# Altium schematic sheet ADC.SchDoc: Analogue to Digital Converter
size A4; ApprovedBy: LD Stanton; Author: LD Stanton; CompanyName: University of Cape Town; DrawnBy: Lawrence Stanton; Engineer: Lawrence Stanton; Organization: University of Cape Town; Address1: Department of Electrical Engineering; Address2: Rondebosch; Address3: Cape Town; Address4: South Africa 7701; DocumentNumber: 8; SheetNumber: 8; SheetTotal: 14
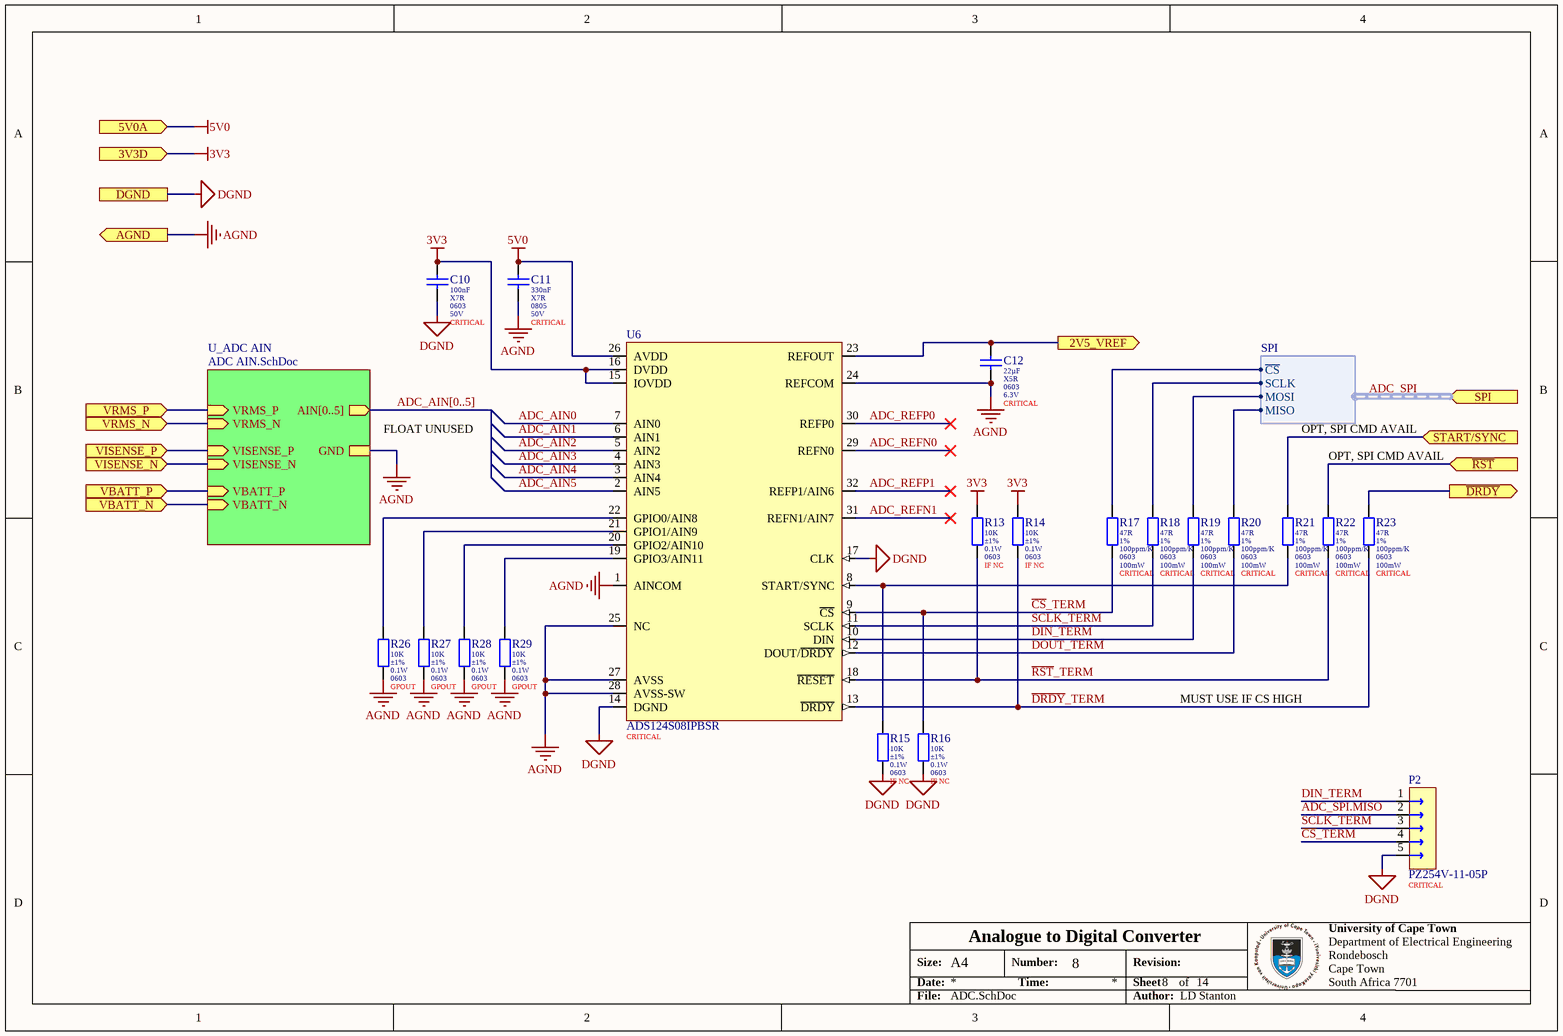
[diagram p0: ADC.SchDoc]

## Parts
C10  value 100nF  Dielectric: X7R  Package: 0603  Voltage: 50V  Populate: CRITICAL  [0603 (Yageo DA) B]  (hidden comment: CC0603KRX7R9BB104)
C11  value 330nF  Dielectric: X7R  Package: 0805  Voltage: 50V  Populate: CRITICAL  [0805_125_F (Samsumg) B]  (hidden comment: CL21B334KBFNNNE)
C12  value 22µF  Dielectric: X5R  Package: 0603  Voltage: 6.3V  Populate: CRITICAL  [0603_080_8 (Samsung) B]  (hidden comment: CL10A226MQ8NRNC)
P2  PZ254V-11-05P  Placement: CRITICAL  [Pin Header 5 1 Male Vertical]
R13  value 10K  Tolerance: ±1%  Power: 0.1W  Package: 0603  Populate: IF NC  [0603 (Uniroyal) B]  (hidden comment: 0603WAF1002T5E)
R14  value 10K  Tolerance: ±1%  Power: 0.1W  Package: 0603  Populate: IF NC  [0603 (Uniroyal) B]  (hidden comment: 0603WAF1002T5E)
R15  value 10K  Tolerance: ±1%  Power: 0.1W  Package: 0603  Populate: IF NC  [0603 (Uniroyal) B]  (hidden comment: 0603WAF1002T5E)
R16  value 10K  Tolerance: ±1%  Power: 0.1W  Package: 0603  Populate: IF NC  [0603 (Uniroyal) B]  (hidden comment: 0603WAF1002T5E)
R17  value 47R  Tolerance: 1%  Temperature Coefficient: 100ppm/K  Package: 0603  Power: 100mW  Populate: CRITICAL  [0603 (Uniroyal) B]  (hidden comment: 0603WAF470JT5E)
R18  value 47R  Tolerance: 1%  Temperature Coefficient: 100ppm/K  Package: 0603  Power: 100mW  Populate: CRITICAL  [0603 (Uniroyal) B]  (hidden comment: 0603WAF470JT5E)
R19  value 47R  Tolerance: 1%  Temperature Coefficient: 100ppm/K  Package: 0603  Power: 100mW  Populate: CRITICAL  [0603 (Uniroyal) B]  (hidden comment: 0603WAF470JT5E)
R20  value 47R  Tolerance: 1%  Temperature Coefficient: 100ppm/K  Package: 0603  Power: 100mW  Populate: CRITICAL  [0603 (Uniroyal) B]  (hidden comment: 0603WAF470JT5E)
R21  value 47R  Tolerance: 1%  Temperature Coefficient: 100ppm/K  Package: 0603  Power: 100mW  Populate: CRITICAL  [0603 (Uniroyal) B]  (hidden comment: 0603WAF470JT5E)
R22  value 47R  Tolerance: 1%  Temperature Coefficient: 100ppm/K  Package: 0603  Power: 100mW  Populate: CRITICAL  [0603 (Uniroyal) B]  (hidden comment: 0603WAF470JT5E)
R23  value 47R  Tolerance: 1%  Temperature Coefficient: 100ppm/K  Package: 0603  Power: 100mW  Populate: CRITICAL  [0603 (Uniroyal) B]  (hidden comment: 0603WAF470JT5E)
R26  value 10K  Tolerance: ±1%  Power: 0.1W  Package: 0603  Populate: GPOUT  [0603 (Uniroyal) B]  (hidden comment: 0603WAF1002T5E)
R27  value 10K  Tolerance: ±1%  Power: 0.1W  Package: 0603  Populate: GPOUT  [0603 (Uniroyal) B]  (hidden comment: 0603WAF1002T5E)
R28  value 10K  Tolerance: ±1%  Power: 0.1W  Package: 0603  Populate: GPOUT  [0603 (Uniroyal) B]  (hidden comment: 0603WAF1002T5E)
R29  value 10K  Tolerance: ±1%  Power: 0.1W  Package: 0603  Populate: GPOUT  [0603 (Uniroyal) B]  (hidden comment: 0603WAF1002T5E)
U6  ADS124S08IPBSR  Placement: CRITICAL  [QFP-32 (ADS124) A]

## Sub-sheets
U_ADC AIN = ADC AIN.SchDoc: AIN[0..5] (out), VRMS_P (in), VRMS_N (in), GND, VISENSE_P (in), VISENSE_N (in), VBATT_P (in), VBATT_N (in)

## Ports
2V5_VREF (out), 3V3D (in), 5V0A (in), AGND (out), DGND, SPI (in, harness SPI), START/SYNC (in), VBATT_N (in), VBATT_P (in), VISENSE_N (in), VISENSE_P (in), VRMS_N (in), VRMS_P (in), ~{DRDY} (out), ~{RST} (in)

## Harnesses
SPI: ~{CS}, SCLK, MOSI, MISO

## Nets
3V3: C10.1 R13.1 R14.1 U6.15(IOVDD) U6.16(DVDD) ; port 3V3D
5V0: C11.1 U6.26(AVDD) ; port 5V0A
AGND: C11.2 C12.2 R26.2 R27.2 R28.2 R29.2 U6.1(AINCOM) U6.24(REFCOM) U6.25(NC) U6.27(AVSS) U6.28(AVSS-SW) ; port AGND, sheet U_ADC AIN/GND
DGND: C10.2 P2.5 R15.2 R16.2 U6.14(DGND) U6.17(CLK) ; port DGND
2V5_VREF: C12.1 U6.23(REFOUT) ; port 2V5_VREF
~{DRDY}: R23.1 ; port ~{DRDY}
~{RST}: R22.1 ; port ~{RST}
ADC_AIN0: U6.7(AIN0)
ADC_AIN1: U6.6(AIN1)
ADC_AIN2: U6.5(AIN2)
ADC_AIN3: U6.4(AIN3)
ADC_AIN4: U6.3(AIN4)
ADC_AIN5: U6.2(AIN5)
ADC_REFN0: U6.29(REFN0)
ADC_REFN1: U6.31(REFN1/AIN7)
ADC_REFP0: U6.30(REFP0)
ADC_REFP1: U6.32(REFP1/AIN6)
ADC_SPI~{.}CS: R17.1 ; port SPI.~{CS}
ADC_SPI.MISO: R20.1 ; port SPI.MISO
ADC_SPI.MISO: P2.2  [a separate net that carries the same name]
ADC_SPI.MOSI: R19.1 ; port SPI.MOSI
ADC_SPI.SCLK: R18.1 ; port SPI.SCLK
~{CS}_TERM: P2.4 R16.1 R17.2 U6.9(~{CS})
~{DRDY}_TERM: R14.2 R23.2 U6.13(~{DRDY})
DIN_TERM: P2.1 R19.2 U6.10(DIN)
DOUT_TERM: R20.2 U6.12(DOUT/~{DRDY})
~{RST}_TERM: R13.2 R22.2 U6.18(~{RESET})
SCLK_TERM: P2.3 R18.2 U6.11(SCLK)
START/SYNC: R21.1 ; port START/SYNC
VBATT_N: port VBATT_N, sheet U_ADC AIN/VBATT_N
VBATT_P: port VBATT_P, sheet U_ADC AIN/VBATT_P
VISENSE_N: port VISENSE_N, sheet U_ADC AIN/VISENSE_N
VISENSE_P: port VISENSE_P, sheet U_ADC AIN/VISENSE_P
VRMS_N: port VRMS_N, sheet U_ADC AIN/VRMS_N
VRMS_P: port VRMS_P, sheet U_ADC AIN/VRMS_P
NetR15_1: R15.1 R21.2 U6.8(START/SYNC)
NetR26_1: R26.1 U6.22(GPIO0/AIN8)
NetR27_1: R27.1 U6.21(GPIO1/AIN9)
NetR28_1: R28.1 U6.20(GPIO2/AIN10)
NetR29_1: R29.1 U6.19(GPIO3/AIN11)

## Buses and harness runs
bus ADC_AIN[0..5] = sheet U_ADC AIN/AIN[0..5]
harness ADC_SPI = port SPI

## Notes on the sheet
- FLOAT UNUSED
- OPT, SPI CMD AVAIL
- MUST USE IF CS HIGH
- Size:
- Date:
- A4
- Number:
- Time:
- Revision:
- Sheet
- of
- File:
- Author:

## Library data of the parts
C10 = CMP-047-000000-9: MLCC 100nF 50V 0603 X7R ±10%; Manufacturer: Yageo; Tolerance: ±10%; ComponentLink1Description: Datasheet; ComponentLink1URL: https://datasheet.lcsc.com/szlcsc/YAGEO-CC0603KRX7R9BB104_C14663.pdf; LCSC Part Number: C14663
C11 = CMP-001-00002-2: MLCC 330nF 0805 50V X7R ±10%; Manufacturer: Samsung; LCSC Part Number: C73142; ComponentLink1URL: https://datasheet.lcsc.com/szlcsc/Samsung-Electro-Mechanics-CL05C100JB5NNNC_C32949.pdf; ComponentLink1Description: Datasheet; Max Operating Temperature: 125°C; Min Operating Temperature: -55°C; Tolerance: 10%
C12 = CMP-00130-1: MLCC 22uF 0603 6V3 X5R ±20%; Manufacturer: Samsung; Tolerance: 20%; ComponentLink1Description: Datasheet; ComponentLink1URL: https://datasheet.lcsc.com/szlcsc/Samsung-Electro-Mechanics-CL05C100JB5NNNC_C32949.pdf; Max Operating Temperature: 85°C; LCSC Part Number: C59461; Min Operating Temperature: -55°C
P2 = CMP-00148-2: Pin Header 5 1 Vertical Male; ComponentLink1URL: https://datasheet.lcsc.com/lcsc/2003191006_XFCN-PZ254V-11-06P_C492405.pdf; LCSC Part Number: C492404; ComponentLink1Description: Datasheet
R13-R16 R26-R29 = CMP-010-000293-9: Resistor 10K 0603 ±1% Thick Film Uniroyal; Working Voltage: 75V; Temperature Coefficient: ±100ppm/K; Temperature: -55 - 155°C; ComponentLink1URL: https://datasheet.lcsc.com/szlcsc/1811062009_UNI-ROYAL-Uniroyal-Elec-0603WAF1002T5E_C25804.pdf; LCSC Part Number: C25804; ComponentLink1Description: Datasheet; Pin Count: 2; Manufacturer: Uniroyal
R17-R23 = CMP-00128-3: Resistor 47R 0603 ±1% Thick Film Uniroyal; Voltage Rating: 75V; ComponentLink1Description: Datasheet; Min Operating Temperature: -55°C; Manufacturer: Uniroyal; ComponentLink1URL: https://datasheet.lcsc.com/szlcsc/1811062009_UNI-ROYAL-Uniroyal-Elec-0603WAF1002T5E_C25804.pdf; Composition: Thick Film; LCSC Part Number: C23182; Max Operating Temperature: 155°C
U6 = CMP-00127-3: ADC, Delta-Sigma, 24-Bit, 1 Func, 12 Channel, Serial Access, PQFP32; Sampling Rate: 4ksps; Resolution: 24; Min Operating Temperature: -50°C; Max Operating Temperature: 125°C; LCSC Part Number: C2870171; ComponentLink2Description: Product Page; ComponentLink2URL: https://www.ti.com/product/ADS124S08/part-details/ADS124S08IPBSR; ComponentLink1Description: Datasheet; ComponentLink1URL: https://www.ti.com/lit/ds/symlink/ads124s08.pdf